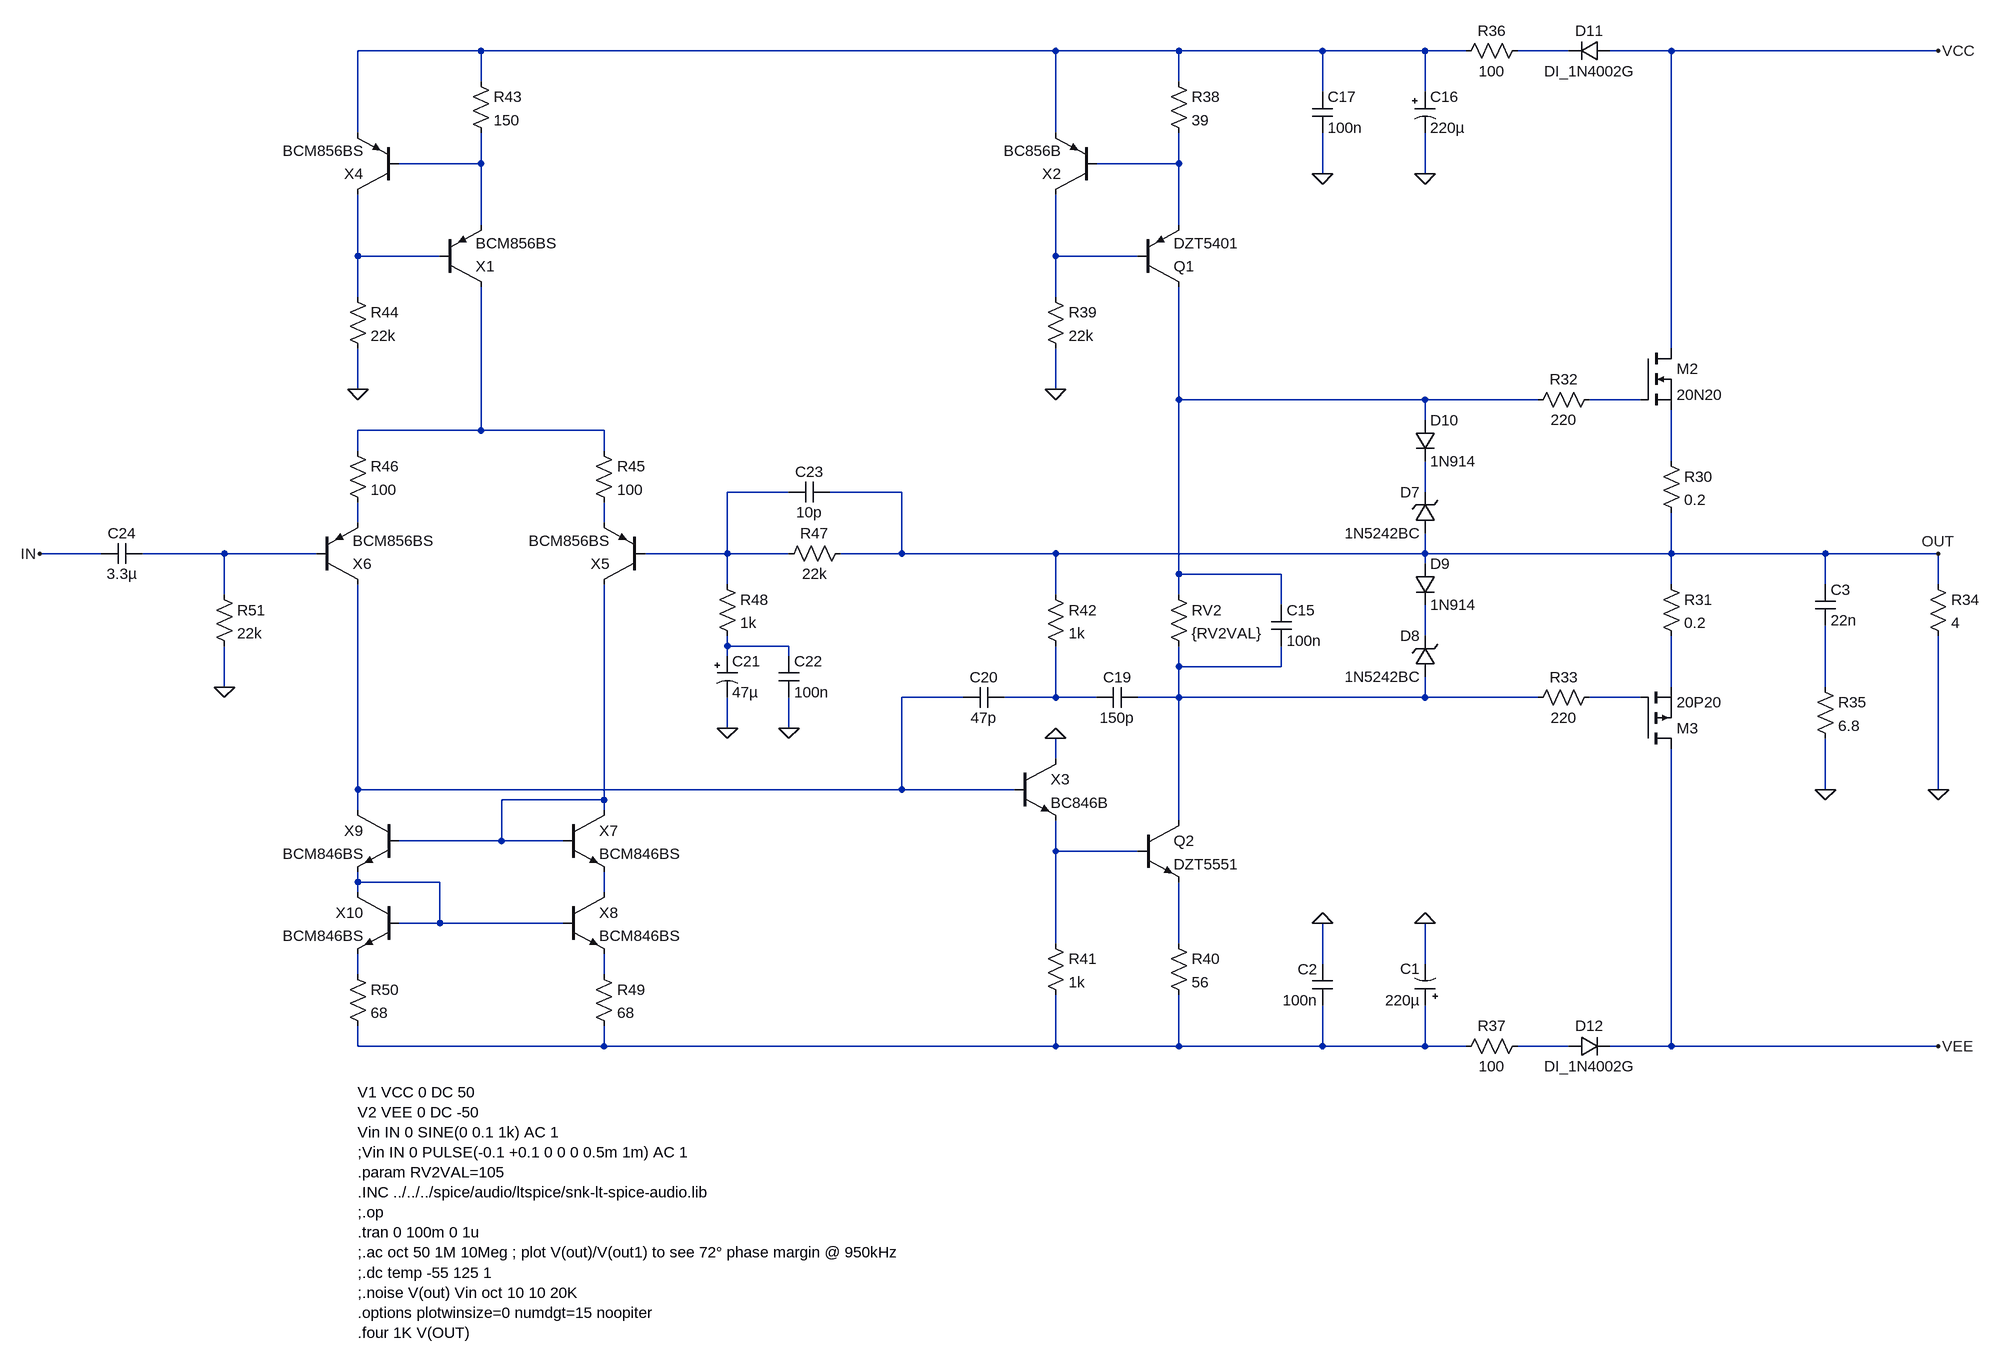
[diagram p0: schematic amp-mosfet-80w.asc]
amp-mosfet-80w.asc, the LTspice schematic file:
Version 4.1
SHEET 1 5268 2452
WIRE 2928 -112 2736 -112
WIRE 3824 -112 2928 -112
WIRE 4016 -112 3824 -112
WIRE 4240 -112 4016 -112
WIRE 4400 -112 4240 -112
WIRE 4464 -112 4400 -112
WIRE 4624 -112 4544 -112
WIRE 4784 -112 4688 -112
WIRE 5200 -112 4784 -112
WIRE 2928 -64 2928 -112
WIRE 4016 -64 4016 -112
WIRE 4240 -48 4240 -112
WIRE 4400 -48 4400 -112
WIRE 2736 16 2736 -112
WIRE 3824 16 3824 -112
WIRE 2928 64 2928 16
WIRE 2928 64 2800 64
WIRE 4016 64 4016 16
WIRE 4016 64 3888 64
WIRE 4240 80 4240 16
WIRE 4400 80 4400 16
WIRE 2928 160 2928 64
WIRE 4016 160 4016 64
WIRE 2736 208 2736 112
WIRE 2864 208 2736 208
WIRE 3824 208 3824 112
WIRE 3952 208 3824 208
WIRE 2736 272 2736 208
WIRE 3824 272 3824 208
WIRE 4784 352 4784 -112
WIRE 2736 416 2736 352
WIRE 3824 416 3824 352
WIRE 4016 432 4016 256
WIRE 4400 432 4016 432
WIRE 4576 432 4400 432
WIRE 4736 432 4656 432
WIRE 4400 464 4400 432
WIRE 2928 480 2928 256
WIRE 2928 480 2736 480
WIRE 3120 480 2928 480
WIRE 2736 512 2736 480
WIRE 3120 512 3120 480
WIRE 4784 528 4784 448
WIRE 3408 576 3312 576
WIRE 3584 576 3472 576
WIRE 4400 576 4400 528
WIRE 2736 624 2736 592
WIRE 3120 624 3120 592
WIRE 2336 672 2240 672
WIRE 2528 672 2400 672
WIRE 2672 672 2528 672
WIRE 3312 672 3312 576
WIRE 3312 672 3184 672
WIRE 3408 672 3312 672
WIRE 3584 672 3584 576
WIRE 3584 672 3488 672
WIRE 3824 672 3584 672
WIRE 4400 672 4400 640
WIRE 4400 672 3824 672
WIRE 4784 672 4784 608
WIRE 4784 672 4400 672
WIRE 5024 672 4784 672
WIRE 5200 672 5024 672
WIRE 4400 688 4400 672
WIRE 4016 704 4016 432
WIRE 4176 704 4016 704
WIRE 3312 720 3312 672
WIRE 4784 720 4784 672
WIRE 5024 720 5024 672
WIRE 5200 720 5200 672
WIRE 2528 736 2528 672
WIRE 3824 736 3824 672
WIRE 4016 736 4016 704
WIRE 4176 752 4176 704
WIRE 4400 800 4400 752
WIRE 3312 816 3312 800
WIRE 3408 816 3312 816
WIRE 3312 832 3312 816
WIRE 3408 832 3408 816
WIRE 4016 848 4016 816
WIRE 4176 848 4176 816
WIRE 4176 848 4016 848
WIRE 2528 880 2528 816
WIRE 4784 880 4784 800
WIRE 5024 880 5024 784
WIRE 3680 896 3584 896
WIRE 3824 896 3824 816
WIRE 3824 896 3744 896
WIRE 3888 896 3824 896
WIRE 4016 896 4016 848
WIRE 4016 896 3952 896
WIRE 4400 896 4400 864
WIRE 4400 896 4016 896
WIRE 4576 896 4400 896
WIRE 4736 896 4656 896
WIRE 3312 944 3312 896
WIRE 3408 944 3408 896
WIRE 3824 992 3824 960
WIRE 2736 1040 2736 720
WIRE 3584 1040 3584 896
WIRE 3584 1040 2736 1040
WIRE 3760 1040 3584 1040
WIRE 5024 1040 5024 960
WIRE 5200 1040 5200 800
WIRE 3120 1056 3120 720
WIRE 3120 1056 2960 1056
WIRE 2736 1072 2736 1040
WIRE 3120 1072 3120 1056
WIRE 4016 1088 4016 896
WIRE 2960 1120 2960 1056
WIRE 2960 1120 2800 1120
WIRE 3056 1120 2960 1120
WIRE 3824 1136 3824 1088
WIRE 3952 1136 3824 1136
WIRE 2736 1184 2736 1168
WIRE 2864 1184 2736 1184
WIRE 2736 1200 2736 1184
WIRE 3120 1200 3120 1168
WIRE 2864 1248 2864 1184
WIRE 2864 1248 2800 1248
WIRE 3056 1248 2864 1248
WIRE 3824 1280 3824 1136
WIRE 4016 1280 4016 1184
WIRE 4240 1312 4240 1248
WIRE 4400 1312 4400 1248
WIRE 2736 1328 2736 1296
WIRE 3120 1328 3120 1296
WIRE 2736 1440 2736 1408
WIRE 3120 1440 3120 1408
WIRE 3120 1440 2736 1440
WIRE 3824 1440 3824 1360
WIRE 3824 1440 3120 1440
WIRE 4016 1440 4016 1360
WIRE 4016 1440 3824 1440
WIRE 4240 1440 4240 1376
WIRE 4240 1440 4016 1440
WIRE 4400 1440 4400 1376
WIRE 4400 1440 4240 1440
WIRE 4464 1440 4400 1440
WIRE 4624 1440 4544 1440
WIRE 4784 1440 4784 976
WIRE 4784 1440 4688 1440
WIRE 5200 1440 4784 1440
FLAG 5024 1040 0
FLAG 5200 1040 0
FLAG 5200 -112 VCC
FLAG 5200 1440 VEE
FLAG 3824 416 0
FLAG 4240 80 0
FLAG 4400 80 0
FLAG 3824 960 0
FLAG 2736 416 0
FLAG 3312 944 0
FLAG 3408 944 0
FLAG 2528 880 0
FLAG 2240 672 IN
FLAG 5200 672 OUT
FLAG 4240 1248 0
FLAG 4400 1248 0
DATAFLAG 4016 560 ""
DATAFLAG 4928 672 ""
DATAFLAG 3488 -112 ""
DATAFLAG 3504 1440 ""
DATAFLAG 3392 1040 ""
DATAFLAG 3040 480 ""
SYMBOL res 4768 512 R0
SYMATTR InstName R30
SYMATTR Value 0.2
SYMBOL res 4768 704 R0
SYMATTR InstName R31
SYMATTR Value 0.2
SYMBOL zener 4416 640 R180
WINDOW 0 24 64 Left 2
WINDOW 3 24 0 Left 2
SYMATTR InstName D7
SYMATTR Value 1N5242BC
SYMBOL zener 4416 864 R180
WINDOW 0 24 64 Left 2
WINDOW 3 24 0 Left 2
SYMATTR InstName D8
SYMATTR Value 1N5242BC
SYMBOL diode 4384 688 R0
SYMATTR InstName D9
SYMATTR Value 1N914
SYMBOL diode 4384 464 R0
SYMATTR InstName D10
SYMATTR Value 1N914
SYMBOL res 4672 416 R90
WINDOW 0 0 56 VBottom 2
WINDOW 3 32 56 VTop 2
SYMATTR InstName R32
SYMATTR Value 220
SYMBOL res 4672 880 R90
WINDOW 0 0 56 VBottom 2
WINDOW 3 32 56 VTop 2
SYMATTR InstName R33
SYMATTR Value 220
SYMBOL res 5184 704 R0
SYMATTR InstName R34
SYMATTR Value 4
SYMBOL res 5008 864 R0
SYMATTR InstName R35
SYMATTR Value 6.8
SYMBOL cap 5008 720 R0
SYMATTR InstName C3
SYMATTR Value 22n
SYMBOL res 4000 720 R0
SYMATTR InstName RV2
SYMATTR Value {RV2VAL}
SYMBOL cap 4160 752 R0
SYMATTR InstName C15
SYMATTR Value 100n
SYMBOL pnp 3952 256 M180
SYMATTR InstName Q1
SYMATTR Value DZT5401
SYMBOL pnp 3888 112 R180
SYMATTR InstName X2
SYMATTR Value BC856B
SYMATTR Prefix X
SYMBOL pmos 4736 976 M180
SYMATTR InstName M3
SYMATTR Value 20P20
SYMBOL nmos 4736 352 R0
SYMATTR InstName M2
SYMATTR Value 20N20
SYMBOL diode 4688 -128 R90
WINDOW 0 0 32 VBottom 2
WINDOW 3 32 32 VTop 2
SYMATTR InstName D11
SYMATTR Value DI_1N4002G
SYMBOL res 4560 -128 R90
WINDOW 0 0 56 VBottom 2
WINDOW 3 32 56 VTop 2
SYMATTR InstName R36
SYMATTR Value 100
SYMBOL diode 4624 1456 R270
WINDOW 0 32 32 VTop 2
WINDOW 3 0 32 VBottom 2
SYMATTR InstName D12
SYMATTR Value DI_1N4002G
SYMBOL res 4560 1424 R90
WINDOW 0 0 56 VBottom 2
WINDOW 3 32 56 VTop 2
SYMATTR InstName R37
SYMATTR Value 100
SYMBOL res 4000 -80 R0
SYMATTR InstName R38
SYMATTR Value 39
SYMBOL res 3808 256 R0
SYMATTR InstName R39
SYMATTR Value 22k
SYMBOL polcap 4384 -48 R0
SYMATTR InstName C16
SYMATTR Value 220µ
SYMBOL cap 4224 -48 R0
SYMATTR InstName C17
SYMATTR Value 100n
SYMBOL npn 3952 1088 R0
SYMATTR InstName Q2
SYMATTR Value DZT5551
SYMBOL res 4000 1264 R0
SYMATTR InstName R40
SYMATTR Value 56
SYMBOL npn 3760 992 R0
SYMATTR InstName X3
SYMATTR Value BC846B
SYMATTR Prefix X
SYMBOL res 3808 1264 R0
SYMATTR InstName R41
SYMATTR Value 1k
SYMBOL cap 3952 880 R90
WINDOW 0 0 32 VBottom 2
WINDOW 3 32 32 VTop 2
SYMATTR InstName C19
SYMATTR Value 150p
SYMBOL cap 3744 880 R90
WINDOW 0 0 32 VBottom 2
WINDOW 3 32 32 VTop 2
SYMATTR InstName C20
SYMATTR Value 47p
SYMBOL res 3808 720 R0
SYMATTR InstName R42
SYMATTR Value 1k
SYMBOL res 2912 -80 R0
SYMATTR InstName R43
SYMATTR Value 150
SYMBOL res 2720 256 R0
SYMATTR InstName R44
SYMATTR Value 22k
SYMBOL res 3104 496 R0
SYMATTR InstName R45
SYMATTR Value 100
SYMBOL res 2720 496 R0
SYMATTR InstName R46
SYMATTR Value 100
SYMBOL res 3504 656 R90
WINDOW 0 0 56 VBottom 2
WINDOW 3 32 56 VTop 2
SYMATTR InstName R47
SYMATTR Value 22k
SYMBOL res 3296 704 R0
SYMATTR InstName R48
SYMATTR Value 1k
SYMBOL polcap 3296 832 R0
SYMATTR InstName C21
SYMATTR Value 47µ
SYMBOL cap 3392 832 R0
SYMATTR InstName C22
SYMATTR Value 100n
SYMBOL pnp 2800 112 R180
SYMATTR InstName X4
SYMATTR Value BCM856BS
SYMATTR Prefix X
SYMBOL pnp 2864 256 M180
SYMATTR InstName X1
SYMATTR Value BCM856BS
SYMATTR Prefix X
SYMBOL pnp 3184 720 R180
SYMATTR InstName X5
SYMATTR Value BCM856BS
SYMATTR Prefix X
SYMBOL pnp 2672 720 M180
SYMATTR InstName X6
SYMATTR Value BCM856BS
SYMATTR Prefix X
SYMBOL cap 3472 560 R90
WINDOW 0 0 32 VBottom 2
WINDOW 3 32 32 VTop 2
SYMATTR InstName C23
SYMATTR Value 10p
SYMBOL npn 3056 1072 R0
SYMATTR InstName X7
SYMATTR Value BCM846BS
SYMATTR Prefix X
SYMBOL npn 3056 1200 R0
SYMATTR InstName X8
SYMATTR Value BCM846BS
SYMATTR Prefix X
SYMBOL npn 2800 1072 M0
SYMATTR InstName X9
SYMATTR Value BCM846BS
SYMATTR Prefix X
SYMBOL npn 2800 1200 M0
SYMATTR InstName X10
SYMATTR Value BCM846BS
SYMATTR Prefix X
SYMBOL res 3104 1312 R0
SYMATTR InstName R49
SYMATTR Value 68
SYMBOL res 2720 1312 R0
SYMATTR InstName R50
SYMATTR Value 68
SYMBOL res 2512 720 R0
SYMATTR InstName R51
SYMATTR Value 22k
SYMBOL cap 2400 656 R90
WINDOW 0 0 32 VBottom 2
WINDOW 3 32 32 VTop 2
SYMATTR InstName C24
SYMATTR Value 3.3µ
SYMBOL polcap 4416 1376 R180
WINDOW 0 24 57 Left 2
WINDOW 3 24 8 Left 2
SYMATTR InstName C1
SYMATTR Value 220µ
SYMBOL cap 4256 1376 R180
WINDOW 0 24 56 Left 2
WINDOW 3 24 8 Left 2
SYMATTR InstName C2
SYMATTR Value 100n
TEXT 2736 1512 Left 2 !V1 VCC 0 DC 50\nV2 VEE 0 DC -50\nVin IN 0 SINE(0 0.1 1k) AC 1\n;Vin IN 0 PULSE(-0.1 +0.1 0 0 0 0.5m 1m) AC 1\n.param RV2VAL=105\n.INC ../../../spice/audio/ltspice/snk-lt-spice-audio.lib\n;.op\n.tran 0 100m 0 1u\n;.ac oct 50 1M 10Meg ; plot V(out)/V(out1) to see 72° phase margin @ 950kHz\n;.dc temp -55 125 1\n;.noise V(out) Vin oct 10 10 20K\n.options plotwinsize=0 numdgt=15 noopiter\n.four 1K V(OUT)

The netlist it stands for:
* amp-mosfet-80w.asc
R30 N010 OUT 0.2
R31 OUT N019 0.2
D7 OUT N012 1N5242BC
D8 N018 N016 1N5242BC
D9 OUT N016 1N914
D10 N007 N012 1N914
R32 N008 N007 220
R33 N023 N018 220
R34 OUT 0 4
R35 N020 0 6.8
C3 OUT N020 22n
RV2 N007 N018 {RV2VAL}
C15 N007 N018 100n
Q1 N007 N006 N004 0 DZT5401
X§X2 N006 N004 N001 BC856B  ; pins C B E
M3 VEE N023 N019 N019 20P20
M2 VCC N008 N010 N010 20N20
D11 VCC N002 DI_1N4002G
R36 N002 N001 100
D12 N032 VEE DI_1N4002G
R37 N032 N031 100
R38 N001 N004 39
R39 N006 0 22k
C16 N001 0 220µ
C17 N001 0 100n
Q2 N018 N025 N028 0 DZT5551
R40 N028 N031 56
X§X3 0 N021 N025 BC846B  ; pins C B E
R41 N025 N031 1k
C19 N018 N022 150p
C20 N022 N021 47p
R42 OUT N022 1k
R43 N001 N003 150
R44 N005 0 22k
R45 N009 N014 100
R46 N009 N013 100
R47 OUT N011 22k
R48 N011 N017 1k
C21 N017 0 47µ
C22 N017 0 100n
X§X4 N005 N003 N001 BCM856BS  ; pins C B E
X§X1 N009 N005 N003 BCM856BS  ; pins C B E
X§X5 N024 N011 N014 BCM856BS  ; pins C B E
X§X6 N021 N015 N013 BCM856BS  ; pins C B E
C23 OUT N011 10p
X§X7 N024 N024 N027 BCM846BS  ; pins C B E
X§X8 N027 N026 N030 BCM846BS  ; pins C B E
X§X9 N021 N024 N026 BCM846BS  ; pins C B E
X§X10 N026 N026 N029 BCM846BS  ; pins C B E
R49 N030 N031 68
R50 N029 N031 68
R51 N015 0 22k
C24 N015 IN 3.3µ
C1 N031 0 220µ
C2 N031 0 100n
.model D D
.lib standard.dio
.model NPN NPN
.model PNP PNP
.lib standard.bjt
.model NMOS NMOS
.model PMOS PMOS
.lib standard.mos
V1 VCC 0 DC 50
V2 VEE 0 DC -50
Vin IN 0 SINE(0 0.1 1k) AC 1
;Vin IN 0 PULSE(-0.1 +0.1 0 0 0 0.5m 1m) AC 1
.param RV2VAL=105
.INC ../../../spice/audio/ltspice/snk-lt-spice-audio.lib
;.op
.tran 0 100m 0 1u
;.ac oct 50 1M 10Meg ; plot V(out)/V(out1) to see 72° phase margin @ 950kHz
;.dc temp -55 125 1
;.noise V(out) Vin oct 10 10 20K
.options plotwinsize=0 numdgt=15 noopiter
.four 1K V(OUT)
.backanno
.end